# Altium schematic sheet ConnectorSheet-v1.0.SchDoc
size 420 x 297 mm; SheetNumber: 2; SheetTotal: 3
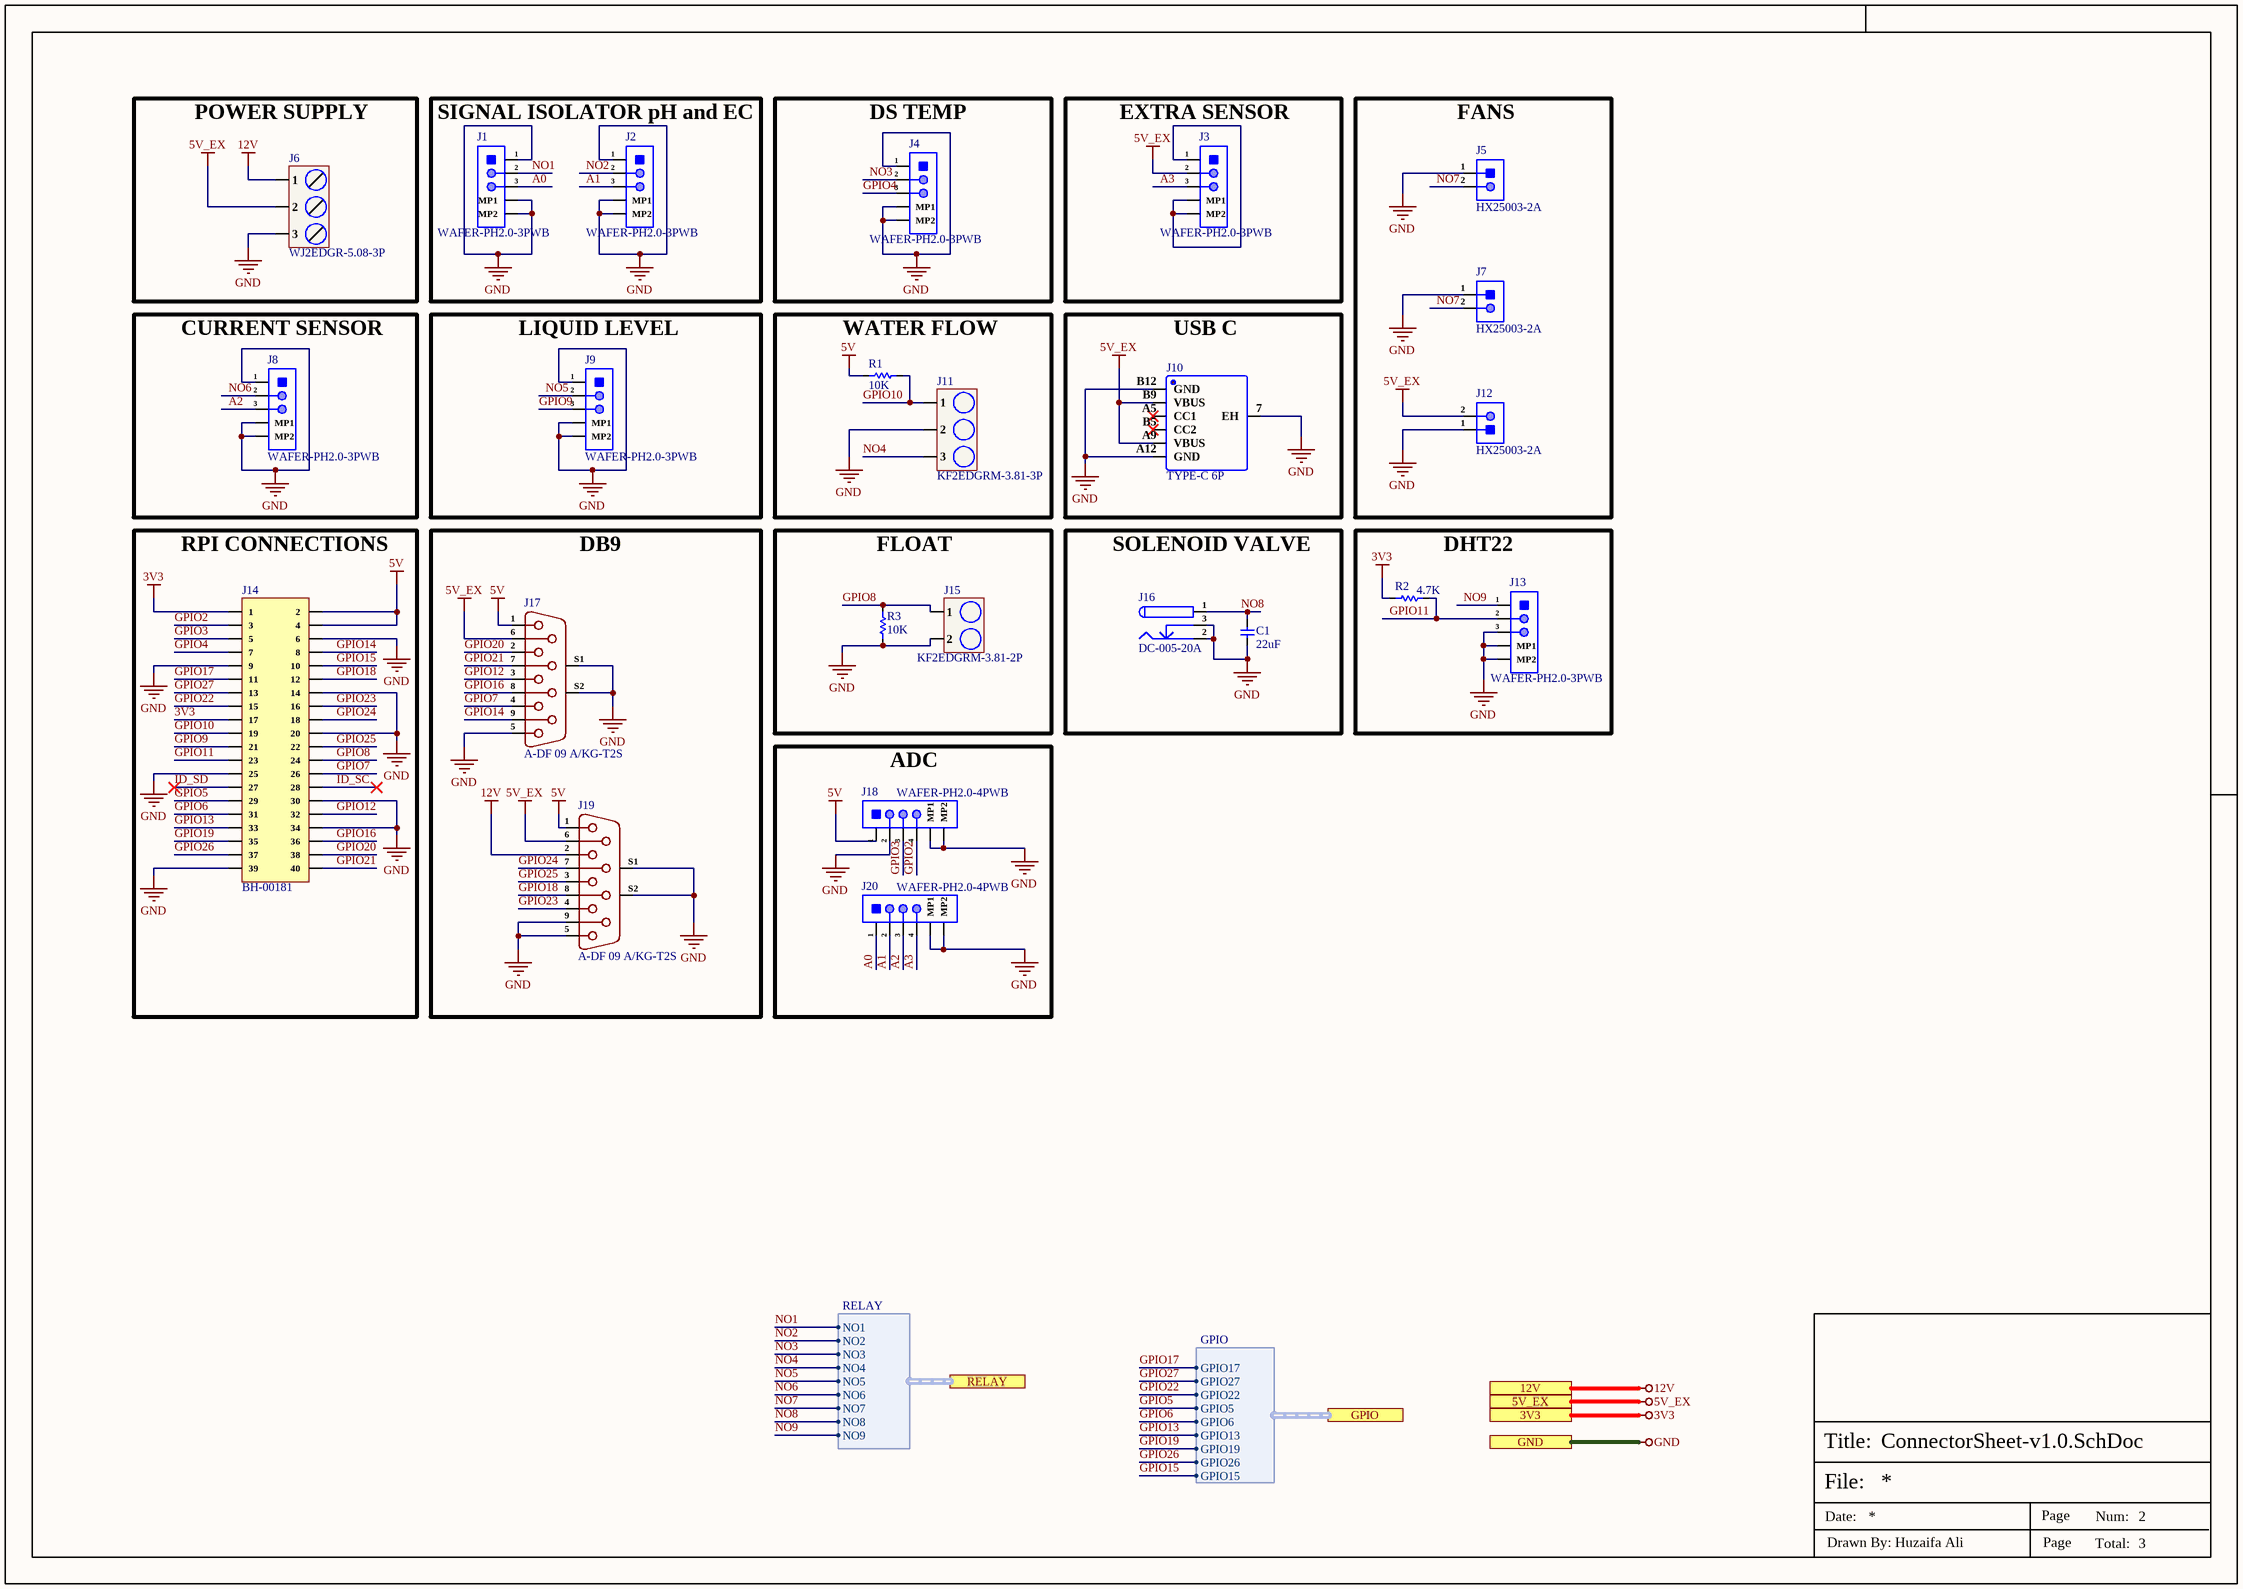
[diagram p0: ConnectorSheet-v1.0.SchDoc]

## Parts
C1  22uF  [Cap-0805]
J1  WAFER-PH2.0-3PWB  [WAFER-PH2.0-3PWB]
J2  WAFER-PH2.0-3PWB  [WAFER-PH2.0-3PWB]
J3  WAFER-PH2.0-3PWB  [WAFER-PH2.0-3PWB]
J4  WAFER-PH2.0-3PWB  [WAFER-PH2.0-3PWB]
J5  HX25003-2A  [HX25003-2A]
J6  WJ2EDGR-5.08-3P  [WJ2EDGR-5.08-3P_]
J7  HX25003-2A  [HX25003-2A]
J8  WAFER-PH2.0-3PWB  [WAFER-PH2.0-3PWB]
J9  WAFER-PH2.0-3PWB  [WAFER-PH2.0-3PWB]
J10  TYPE-C 6P  [TYPE-C 6P]
J11  KF2EDGRM-3.81-3P  [KF2EDGRM-3.81-3P]
J12  HX25003-2A  [HX25003-2A]
J13  WAFER-PH2.0-3PWB  [WAFER-PH2.0-3PWB]
J14  BH-00181  [BH-00181]
J15  KF2EDGRM-3.81-2P  [KF2EDGRM-3.81-2P]
J16  DC-005-20A  [DC-005-20A]
J17  A-DF 09 A/KG-T2S  [A-DF 09 A/KG-T2S]
J18  WAFER-PH2.0-4PWB  [WAFER-PH2.0-4PWB]
J19  A-DF 09 A/KG-T2S  [A-DF 09 A/KG-T2S]
J20  WAFER-PH2.0-4PWB  [WAFER-PH2.0-4PWB]
R1  10K  [Res-0603]
R2  4.7K  [Res-0603]
R3  10K  [Res-0603]

## Blocks framed on the sheet
POWER SUPPLY: J6
SIGNAL ISOLATOR pH and EC: J1 J2
DS TEMP: J4
EXTRA SENSOR: J3
FANS: J5 J7 J12
CURRENT SENSOR: J8
LIQUID LEVEL: J9
WATER FLOW: J11 R1
USB C: J10
RPI CONNECTIONS: J14
DB9: J17 J19
FLOAT: J15 R3
SOLENOID VALVE: C1 J16
DHT22: J13 R2
ADC: J18 J20

## Ports
3V3 (see Top-Sheet[2B], RelaySheet-v1.0[5D]), 5V_EX (see Top-Sheet[2B], RelaySheet-v1.0[5D]), 12V (see Top-Sheet[2B], RelaySheet-v1.0[5D]), GND (see Top-Sheet[2B], RelaySheet-v1.0[5D]), GPIO (harness GPIO, see Top-Sheet[2B], RelaySheet-v1.0[4D]), RELAY (harness RELAY, see Top-Sheet[2B], RelaySheet-v1.0[4D])

## Harnesses
GPIO: GPIO17, GPIO27, GPIO22, GPIO5, GPIO6, GPIO13, GPIO19, GPIO26, GPIO15
RELAY: NO2, NO1, NO3, NO4, NO5, NO6, NO7, NO8, NO9

## Nets
3V3: J14.1 J14.17 R2.1 ; port 3V3
5V: J14.2 J14.4 J17.1 J18.1 J19.1 R1.2
5V_EX: J3.2 J6.2 J10.A9(VBUS) J10.B9(VBUS) J12.2 J17.6 J19.6 ; port 5V_EX
12V: J6.1 J19.2 ; port 12V
GND: C1.1 J1.1 J1.MP1 J1.MP2 J2.1 J2.MP1 J2.MP2 J4.1 J4.MP1 J4.MP2 J5.1 J6.3 J7.1 J8.1 J8.MP1 J8.MP2 J9.1 J9.MP1 J9.MP2 J10.7(EH) J10.A12(GND) J10.B12(GND) J11.2 J12.1 J13.3 J13.MP1 J13.MP2 J14.6 J14.9 J14.14 J14.20 J14.25 J14.30 J14.34 J14.39 J15.2 J16.2 J16.3 J17.5 J17.S1 J17.S2 J18.2 J18.MP1 J18.MP2 J19.5 J19.9 J19.S1 J19.S2 J20.MP1 J20.MP2 R3.1 ; port GND
A0: J1.3 J20.1
A1: J2.3 J20.2
A2: J8.3 J20.3
A3: J3.3 J20.4
GPIO2: J14.3 J18.4
GPIO3: J14.5 J18.3
GPIO4: J4.3 J14.7
GPIO5: J14.29 ; port GPIO.GPIO5
GPIO6: J14.31 ; port GPIO.GPIO6
GPIO7: J14.26 J17.4
GPIO8: J14.24 J15.1 R3.2
GPIO9: J9.3 J14.21
GPIO10: J11.1 J14.19 R1.1
GPIO11: J13.2 J14.23 R2.2
GPIO12: J14.32 J17.3
GPIO13: J14.33 ; port GPIO.GPIO13
GPIO14: J14.8 J17.9
GPIO15: J14.10 ; port GPIO.GPIO15
GPIO16: J14.36 J17.8
GPIO17: J14.11 ; port GPIO.GPIO17
GPIO18: J14.12 J19.8
GPIO19: J14.35 ; port GPIO.GPIO19
GPIO20: J14.38 J17.2
GPIO21: J14.40 J17.7
GPIO22: J14.15 ; port GPIO.GPIO22
GPIO23: J14.16 J19.4
GPIO24: J14.18 J19.7
GPIO25: J14.22 J19.3
GPIO26: J14.37 ; port GPIO.GPIO26
GPIO27: J14.13 ; port GPIO.GPIO27
ID_SC: J14.28
ID_SD: J14.27
NO1: J1.2 ; port RELAY.NO1
NO2: J2.2 ; port RELAY.NO2
NO3: J4.2 ; port RELAY.NO3
NO4: J11.3 ; port RELAY.NO4
NO5: J9.2 ; port RELAY.NO5
NO6: J8.2 ; port RELAY.NO6
NO7: J5.2 J7.2 ; port RELAY.NO7
NO8: C1.2 J16.1 ; port RELAY.NO8
NO9: J13.1 ; port RELAY.NO9
NetJ3_1: J3.1 J3.MP1 J3.MP2

Not connected (* = marked no-connect by the designer): J10 A5(CC1)* B5(CC2)*

## Notes on the sheet
- File:
- Title:
- Date:
- Page
- Num:
- Total:
- Drawn By: Huzaifa Ali

## Library data of the parts
C1 = C2012X5R1V226MT000E: CAP CER 22UF 35V X5R 0805; Manufacturer: TDK Corporation; Item Type: Capacitor; Manufacturer Part Number: C2012X5R1V226MT000E; Package: 0805; ComponentLink1Description: LCSC; ComponentLink1URL: https://www.lcsc.com/product-detail/Multilayer-Ceramic-Capacitors-MLCC-SMD-SMT_TDK-C2012X5R1V226M125AC_C2179409.html; LCSC Part Number: C338080
J1-J4 J8 J9 J13 = WAFER-PH2.0-3PWB: 1x3P 3P 1 2mm 3 -25℃~+85℃ 2A Surface Mount，Right Angle SMD,P=2mm,Surface Mount，Right Angle Wire To Board Connector ROHS; Manuacturer: XUNPU; Manufacturer Part Number: WAFER-PH2.0-3PWB; LCSC Part Number: C3029441; Item Type: Connector; ComponentLink1Description: LCSC; ComponentLink1URL: https://www.lcsc.com/product-detail/Wire-To-Board-Connector_XUNPU-WAFER-PH2-0-3PWB_C3029441.html
J5 J7 J12 = HX25003-2A: 1x2P 2P XH 1 2.5mm 2 Straight Plugin,P=2.5mm Wire To Board Connector ROHS; Manufacturer: HX; Manufacturer Part Number: HX25003-2A; Package: Plugin,P=2.5mm; LCSC Part Number: C442299; Item Type: Wire To Board Connector; ComponentLink1Description: LCSC; ComponentLink1URL: https://www.lcsc.com/product-detail/Wire-To-Board-Connector_HX-Zhejiang-Yueqing-Hongxing-Elec-HX25003-2A_C442299.html
J6 = WJ2EDGR-5.08-3P: 3 Bend 1 5.08mm Green Board Edge/Receptacle-Open Push-Pull,P=5.08mm Pluggable System Terminal Block ROHS; Manufacturer: Ningbo Kangnex Elec; Manufacturer Part Number: WJ2EDGR-5.08-3P; Package: Push-Pull,P=5.08mm; LCSC Part Number: C70914; Item Type: Terminal Block; ComponentLink1Description: LCSC; ComponentLink1URL: https://www.lcsc.com/product-detail/Pluggable-System-span-style-background-color-ff0-Terminal-span-Block_Ningbo-Kangnex-Elec-WJ2EDGR-5-08-3P_C70914.html
J10 = TYPE-C 6P: 1 Surface Mount，Right Angle 6P Female -40℃~+85℃ Type-C SMD USB Connectors ROHS; Manufacturer: SHOU HAN; Manufacturer Part Number: TYPE-C 6P; Package: SMD; LCSC Part Number: C456012; Item Type: Type-C SMD; ComponentLink1Description: LCSC; ComponentLink1URL: https://www.lcsc.com/product-detail/USB-Connectors_SHOU-HAN-TYPE-C-6P_C456012.html
J11 = KF2EDGRM-3.81-3P: 300V 8A 3 Bend -40℃~+105℃ 1 3.81mm 1x3P Green Board Edge/Receptacle-Close Screw fixed Push-Pull,P=3.81mm Pluggable System Terminal Block ROHS; Manufacturer: Cixi Kefa Elec; Manufacturer Part Number: KF2EDGRM-3.81-3P; Package: Push-Pull,P=3.81mm; LCSC Part Number: C441269; Item Type: Terminal Block; ComponentLink1Description: LCSC; ComponentLink1URL: https://www.lcsc.com/product-detail/Pluggable-System-Terminal-Block_Cixi-Kefa-Elec-KF2EDGRM-3-81-3P_C441269.html
J14 = BH-00181: 2.54mm -40℃~+105℃ Brick nogging 3A 2x20P 20 Push - Pull 2.54mm 2 SMD,P=2.54mm IDC Connectors ROHS; Manufacturer: Liansheng; Manufacturer Part Number: BH-00181; Package: SMD,P=2.54mm; LCSC Part Number: C2685075; Item Type: IDC Connector; ComponentLink1Description: LCSC; ComponentLink1URL: https://www.lcsc.com/product-detail/IDC-Connectors_Liansheng-BH-00181_C2685075.html
J15 = KF2EDGRM-3.81-2P: 300V 8A 2 Bend -40℃~+105℃ 1 3.81mm 1x2P Green Board Edge/Receptacle-Close Screw fixed Push-Pull,P=3.81mm Pluggable System Terminal Block ROHS; Manufacturer: Cixi Kefa Elec; Manufacturer Part Number: KF2EDGRM-3.81-2P; Package: Push-Pull,P=3.81mm; LCSC Part Number: C441268; Item Type: Terminal Block; ComponentLink1Description: LCSC; ComponentLink1URL: https://www.lcsc.com/product-detail/Pluggable-System-Terminal-Block_Cixi-Kefa-Elec-KF2EDGRM-3-81-2P_C441268.html
J16 = DC-005-20A: 2mm 6.4mm 500mA 30V Plugin DC Power Connector ROHS; Manufacturer: Korean Hroparts Elec; Manufacturer Part Number: DC-005-20A; Package: Plugin; LCSC Part Number: C136744; Item Type: DC Power Connector; ComponentLink1Description: LCSC; ComponentLink1URL: https://www.lcsc.com/product-detail/DC-Power-Connector_Korean-Hroparts-Elec-DC-005-20A_C136744.html
J17 J19 = A-DF 09 A/KG-T2S: CONN D-SUB RCPT 9POS R/A SLDR; Manufacturer: Assmann; Item Type: D-Sub Connectors; Number of Contacts: 9NUMBER; Supplier: Digikey; Supplier Part Number: AE10921-ND; Manufacturer Part Number: A-DF 09 A/KG-T2S; RoHS: Yes; Stock: 23990; Pricing: 1=0.78, 10=0.661, 25=0.6336, 40=0.62025, 90=0.59322, 270=0.53933, 450=0.4854, 990=0.43147, 2430=0.39102 (USD); Height: 12.68mm; Lead Free: 5697LeadFree; ComponentLink1URL: https://datasheet.ciiva.com/26927/getdatasheetpartid-755627-26927441.pdf?src-supplier=Verical; ComponentLink1Description: https://datasheet.ciiva.com/26927/getdatasheetpartid-755627-26927441.pdf?src-supplier=Verical
J18 J20 = WAFER-PH2.0-4PWB: 1x4P 1 2mm Male pin 4 -25℃~+85℃ 2A Surface Mount SMD,P=2mm Wire To Board / Wire To Wire Connector ROHS / C3029442; Manuacturer: XUNPU; Manufacturer Part Number: WAFER-PH2.0-4PWB; LCSC Part Number: C3029442; Item Type: Connector; ComponentLink1Description: LCSC; ComponentLink1URL: https://www.lcsc.com/product-detail/Wire-To-Board-Wire-To-Wire-Connector_XUNPU-WAFER-PH2-0-4PWB_C3029442.html
R1 = RK73G1JTTD1002F: RES 10K OHM 1% 1/10W 0603; Item Type: Resistor; Value: 10kR; Power Rating: 100mW; Voltage Rating: 75V; Temperature Coefficient: 50ppm/°C; LCSC Part Number: C362180; ComponentLink1Description: LCSC; Supplier: Digi-Key; Supplier Part Number: 2019-RK73G1JTTD1002FCT-ND; RoHS: Yes; Category: Chip SMD Resistors; Stock: 249394; Pricing: 1=0.22, 10=0.118, 50=0.0812, 100=0.0699, 500=0.0513, 1000=0.04545 (USD); Case/Package: 0603; Case Code (Imperial): 0603; Case Code (Metric): 1608; Min Operating Temperature: -55°C; Max Operating Temperature: 125°C; Tolerance: 1%; Packaging: Tape and Reel; Termination: SMD/SMT; Series: RK73G; Construction: Rectangular; Length: 1.6mm; Depth: 0.8mm; Military Standard: Not; RoHS Compliant: Yes; ComponentLink2URL: http://www.mouser.com/ds/2/219/RK73G-9863.pdf?src-supplier=Mouser; ComponentLink2Description: http://www.mouser.com/ds/2/219/RK73G-9863.pdf?src-supplier=Mouser
R2 = RC0603FR-074K7L: RES SMD 4.7K OHM 1% 1/10W 0603; Manufacturer: Yageo; Item Type: Resistor; Manufacturer Part Number: RC0603FR-074K7L; Package: 0603; ComponentLink7Description: LCSC; ComponentLink7URL: https://www.lcsc.com/product-detail/Chip-Resistor-Surface-Mount_YAGEO-RC0603FR-074K7L_C99782.html; LCSC Part Number: C99782
R3 = 0603WAF1002T5E: 100mW Thick Film Resistors 75V ±100ppm/℃ ±1% 10kΩ 0603 Chip Resistor - Surface Mount ROHS; Manufacturer: UNI-ROYAL(Uniroyal Elec); Manufacturer Part Number: 0603WAF1002T5E; Value: 10K; Package: 0603; ComponentLink1Description: LCSC; ComponentLink1URL: https://www.lcsc.com/product-detail/Chip-Resistor-Surface-Mount_UNI-ROYAL-Uniroyal-Elec-0603WAF1002T5E_C25804.html; LCSC Part Number: C25804; Item Type: Resistor